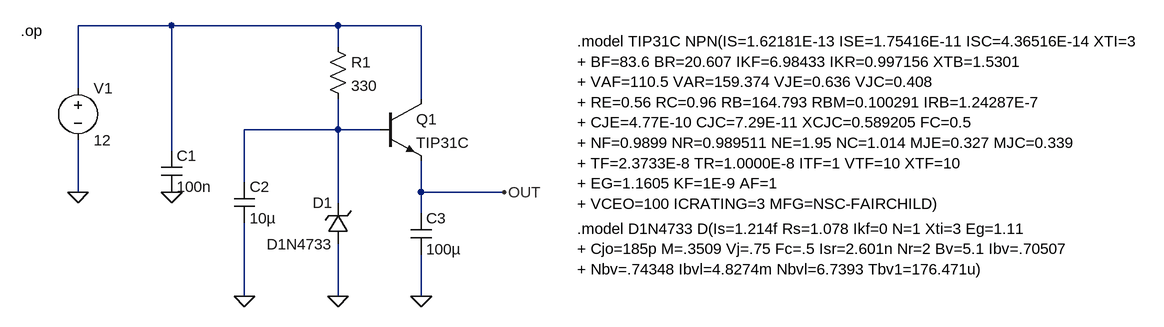
[diagram p0: schematic Stabilizator_12_5.asc]
Stabilizator_12_5.asc, the LTspice schematic file:
Version 4.1
SHEET 1 2172 680
WIRE 192 -96 48 -96
WIRE 448 -96 192 -96
WIRE 576 -96 448 -96
WIRE 448 -64 448 -96
WIRE 48 0 48 -96
WIRE 576 16 576 -96
WIRE 448 64 448 16
WIRE 448 64 304 64
WIRE 512 64 448 64
WIRE 192 96 192 -96
WIRE 304 144 304 64
WIRE 48 160 48 80
WIRE 576 160 576 112
WIRE 704 160 576 160
WIRE 448 176 448 64
WIRE 576 192 576 160
WIRE 304 320 304 208
WIRE 448 320 448 240
WIRE 576 320 576 256
FLAG 48 160 0
FLAG 448 320 0
FLAG 576 320 0
FLAG 304 320 0
FLAG 192 160 0
FLAG 704 160 OUT
SYMBOL voltage 48 -16 R0
WINDOW 123 0 0 Left 0
WINDOW 39 0 0 Left 0
SYMATTR InstName V1
SYMATTR Value 12
SYMBOL cap 176 96 R0
SYMATTR InstName C1
SYMATTR Value 100n
SYMBOL res 432 -80 R0
SYMATTR InstName R1
SYMATTR Value 330
SYMBOL cap 288 144 R0
SYMATTR InstName C2
SYMATTR Value 10µ
SYMBOL zener 464 240 R180
WINDOW 0 24 64 Left 2
WINDOW 3 24 0 Left 2
SYMATTR InstName D1
SYMATTR Value D1N4733
SYMBOL npn 512 16 R0
SYMATTR InstName Q1
SYMATTR Value TIP31C
SYMBOL cap 560 192 R0
SYMATTR InstName C3
SYMATTR Value 100µ
TEXT 816 -72 Left 2 !.model TIP31C NPN(IS=1.62181E-13 ISE=1.75416E-11 ISC=4.36516E-14 XTI=3\n+ BF=83.6 BR=20.607 IKF=6.98433 IKR=0.997156 XTB=1.5301\n+ VAF=110.5 VAR=159.374 VJE=0.636 VJC=0.408\n+ RE=0.56 RC=0.96 RB=164.793 RBM=0.100291 IRB=1.24287E-7\n+ CJE=4.77E-10 CJC=7.29E-11 XCJC=0.589205 FC=0.5\n+ NF=0.9899 NR=0.989511 NE=1.95 NC=1.014 MJE=0.327 MJC=0.339\n+ TF=2.3733E-8 TR=1.0000E-8 ITF=1 VTF=10 XTF=10\n+ EG=1.1605 KF=1E-9 AF=1\n+ VCEO=100 ICRATING=3 MFG=NSC-FAIRCHILD)
TEXT -40 -88 Left 2 !.op
TEXT 816 216 Left 2 !.model D1N4733 D(Is=1.214f Rs=1.078 Ikf=0 N=1 Xti=3 Eg=1.11\n+ Cjo=185p M=.3509 Vj=.75 Fc=.5 Isr=2.601n Nr=2 Bv=5.1 Ibv=.70507\n+ Nbv=.74348 Ibvl=4.8274m Nbvl=6.7393 Tbv1=176.471u)

The netlist it stands for:
* Stabilizator_12_5.asc
V1 N001 0 12
C1 N001 0 100n
R1 N001 N002 330
C2 N002 0 10µ
D1 0 N002 D1N4733
Q1 N001 N002 OUT 0 TIP31C
C3 OUT 0 100µ
.model D D
.lib standard.dio
.model NPN NPN
.model PNP PNP
.lib standard.bjt
.model TIP31C NPN(IS=1.62181E-13 ISE=1.75416E-11 ISC=4.36516E-14 XTI=3
+ BF=83.6 BR=20.607 IKF=6.98433 IKR=0.997156 XTB=1.5301
+ VAF=110.5 VAR=159.374 VJE=0.636 VJC=0.408
+ RE=0.56 RC=0.96 RB=164.793 RBM=0.100291 IRB=1.24287E-7
+ CJE=4.77E-10 CJC=7.29E-11 XCJC=0.589205 FC=0.5
+ NF=0.9899 NR=0.989511 NE=1.95 NC=1.014 MJE=0.327 MJC=0.339
+ TF=2.3733E-8 TR=1.0000E-8 ITF=1 VTF=10 XTF=10
+ EG=1.1605 KF=1E-9 AF=1
+ VCEO=100 ICRATING=3 MFG=NSC-FAIRCHILD)
.op
.model D1N4733 D(Is=1.214f Rs=1.078 Ikf=0 N=1 Xti=3 Eg=1.11
+ Cjo=185p M=.3509 Vj=.75 Fc=.5 Isr=2.601n Nr=2 Bv=5.1 Ibv=.70507
+ Nbv=.74348 Ibvl=4.8274m Nbvl=6.7393 Tbv1=176.471u)
.backanno
.end